# Altium schematic sheet KIT_ARDUINO_CPU_R00.SchDoc: KIT ARDUINO 2022
size A4; Author: Valeria Bank; CompanyName: Sistemas De Representacion; Revision: R00; SheetNumber: 2; SheetTotal: 4
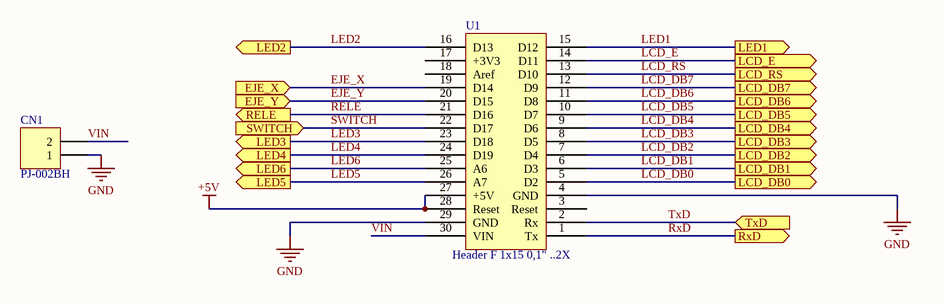
[diagram p0: KIT_ARDUINO_CPU_R00.SchDoc]

## Parts
CN1  PJ-002BH  [PJ002B]
U1  Header F 1x15 0,1" ..2X  [Arduino Nano]

## Ports
EJE_X (in), EJE_Y (in), LCD_DB0 (out), LCD_DB1 (out), LCD_DB2 (out), LCD_DB3 (out), LCD_DB4 (out), LCD_DB5 (out), LCD_DB6 (out), LCD_DB7 (out), LCD_E (out), LCD_RS (out), LED1 (out), LED2 (out), LED3 (out), LED4 (out), LED5 (out), LED6 (out), RELE (out), RxD (out), SWITCH (in), TxD (in)

## Nets
+5V: U1.27(+5V) U1.28(Reset)
GND: CN1.1 U1.4(GND) U1.29(GND)
EJE_X: U1.19(D14) ; port EJE_X
EJE_Y: U1.20(D15) ; port EJE_Y
LCD_DB0: U1.5(D2) ; port LCD_DB0
LCD_DB1: U1.6(D3) ; port LCD_DB1
LCD_DB2: U1.7(D4) ; port LCD_DB2
LCD_DB3: U1.8(D5) ; port LCD_DB3
LCD_DB4: U1.9(D6) ; port LCD_DB4
LCD_DB5: U1.10(D7) ; port LCD_DB5
LCD_DB6: U1.11(D8) ; port LCD_DB6
LCD_DB7: U1.12(D9) ; port LCD_DB7
LCD_E: U1.14(D11) ; port LCD_E
LCD_RS: U1.13(D10) ; port LCD_RS
LED1: U1.15(D12) ; port LED1
LED2: U1.16(D13) ; port LED2
LED3: U1.23(D18) ; port LED3
LED4: U1.24(D19) ; port LED4
LED5: U1.26(A7) ; port LED5
LED6: U1.25(A6) ; port LED6
RELE: U1.21(D16) ; port RELE
RxD: U1.1(Tx) ; port RxD
SWITCH: U1.22(D17) ; port SWITCH
TxD: U1.2(Rx) ; port TxD
VIN: CN1.2 U1.30(VIN)

Not connected (* = marked no-connect by the designer): U1 3(Reset) 17(+3V3) 18(Aref)

## Notes on the sheet
- Title:
- Size:
- Author:
- A4
- Sheet
- of
- Revision:
- File:
- Date:

## Library data of the parts
CN1 = Header 2: Header, 2-Pin; LatestRevisionDate: 17-Jul-2002; LatestRevisionNote: Re-released for DXP Platform.; Publisher: Altium Limited
U1 = Arduino Nano: Microcontroller